# Altium schematic sheet USBHUB.SchDoc
size A
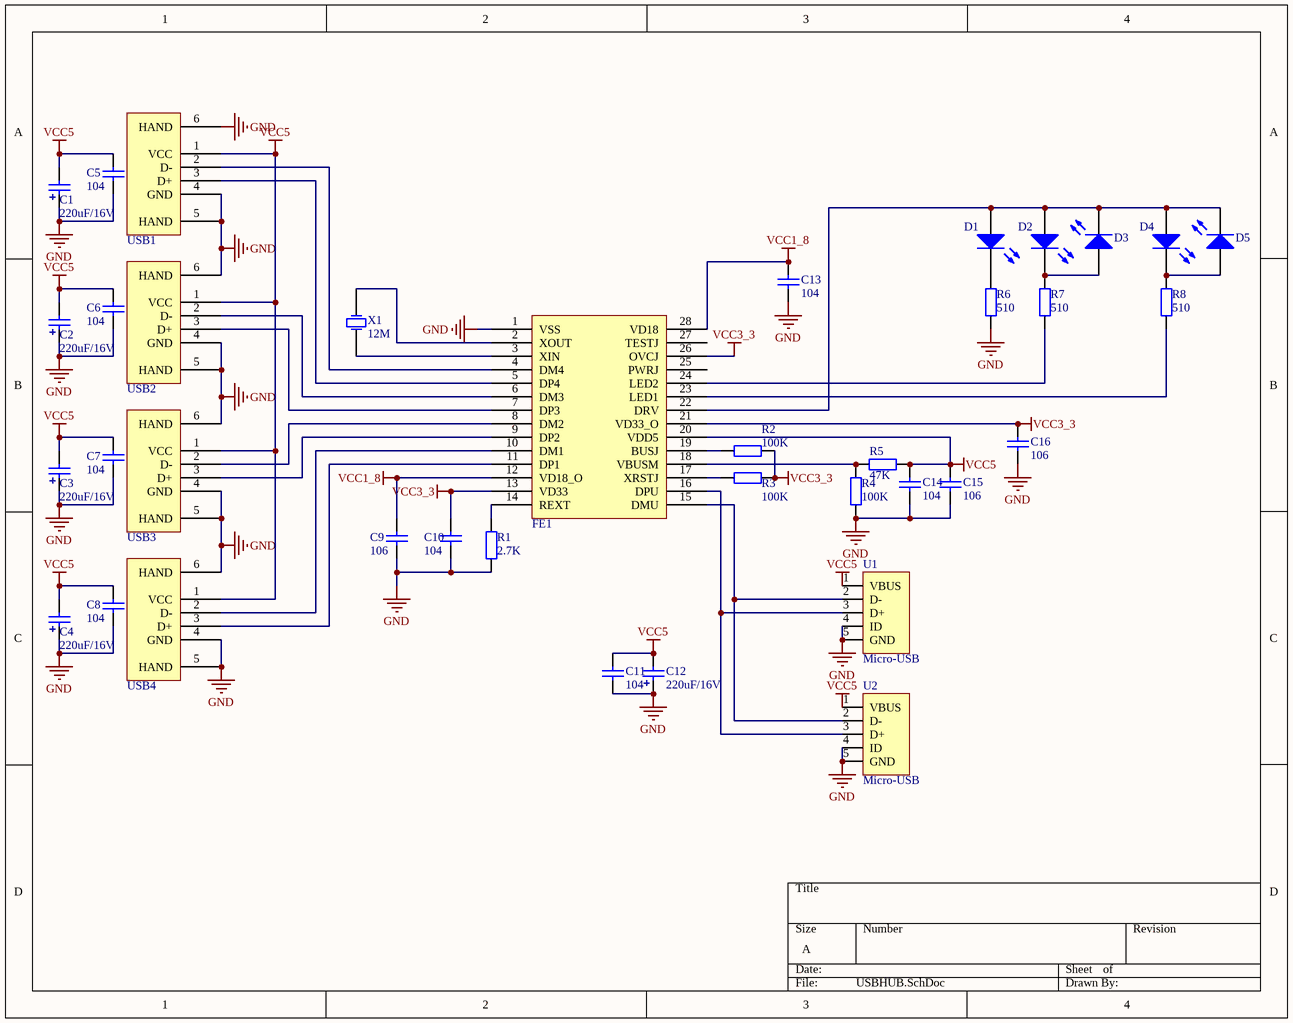
[diagram p0: USBHUB.SchDoc]

## Parts
C1  value 220uF/16V  [cap_220uF/16V]  (hidden comment: Cap_Pol)
C2  value 220uF/16V  [cap_220uF/16V]  (hidden comment: Cap_Pol)
C3  value 220uF/16V  [cap_220uF/16V]  (hidden comment: Cap_Pol)
C4  value 220uF/16V  [cap_220uF/16V]  (hidden comment: Cap_Pol)
C5  value 104  [0603]  (hidden comment: Cap1)
C6  value 104  [0603]  (hidden comment: Cap1)
C7  value 104  [0603]  (hidden comment: Cap1)
C8  value 104  [0603]  (hidden comment: Cap1)
C9  value 106  [2012[0805]-C]  (hidden comment: Cap1)
C10  value 104  [0603]  (hidden comment: Cap1)
C11  value 104  [0603]  (hidden comment: Cap1)
C12  value 220uF/16V  [cap_220uF/16V]  (hidden comment: Cap_Pol)
C13  value 104  [0603]  (hidden comment: Cap1)
C14  value 104  [0603]  (hidden comment: Cap1)
C15  value 106  [2012[0805]-C]  (hidden comment: Cap1)
C16  value 106  [2012[0805]-C]  (hidden comment: Cap1)
D1  LED  [0603-Polar]  (value not drawn)
D2  LED  [0603-Polar]  (value not drawn)
D3  LED  [0603-Polar]  (value not drawn)
D4  LED  [0603-Polar]  (value not drawn)
D5  LED  [0603-Polar]  (value not drawn)
FE1  FE1.1s  [SSOP-28]  (value not drawn)
R1  value 2.7K  [0603]  (hidden comment: Res1)
R2  value 100K  [0603]  (hidden comment: Res1)
R3  value 100K  [0603]  (hidden comment: Res1)
R4  value 100K  [0603]  (hidden comment: Res1)
R5  value 47K  [0603]  (hidden comment: Res1)
R6  value 510  [0603]  (hidden comment: Res1)
R7  value 510  [0603]  (hidden comment: Res1)
R8  value 510  [0603]  (hidden comment: Res1)
U1  Micro-USB  [MICRO-USB-F]
U2  Micro-USB  [MICRO-USB-F]
USB1  USB  [USB2.5-2V4A]  (value not drawn)
USB2  USB  [USB2.5-2V4A]  (value not drawn)
USB3  USB  [USB2.5-2V4A]  (value not drawn)
USB4  USB  [USB2.5-2V4A]  (value not drawn)
X1  12M  [XTAL_SMD]

## Nets
GND: C1.1 C2.1 C3.1 C4.1 C5.1 C6.1 C7.1 C8.1 C9.1 C10.1 C11.1 C12.1 C13.2 C14.1 C15.1 C16.1 FE1.1(VSS) R1.1 R4.1 R6.1 U1.4(ID) U1.5(GND) U2.4(ID) U2.5(GND) USB1.4(GND) USB1.5(HAND) USB1.6(HAND) USB2.4(GND) USB2.5(HAND) USB2.6(HAND) USB3.4(GND) USB3.5(HAND) USB3.6(HAND) USB4.4(GND) USB4.5(HAND) USB4.6(HAND)
VCC1_8: C9.2 C13.1 FE1.12(VD18_O) FE1.28(VD18)
VCC3_3: C10.2 C16.2 FE1.13(VD33) FE1.21(VD33_O) FE1.26(OVCJ) R2.2 R3.2
VCC5: C1.2 C2.2 C3.2 C4.2 C5.2 C6.2 C7.2 C8.2 C11.2 C12.2 C14.2 C15.2 FE1.20(VDD5) R5.2 U1.1(VBUS) U2.1(VBUS) USB1.1(VCC) USB2.1(VCC) USB3.1(VCC) USB4.1(VCC)
NetD1_1: D1.1(A) D2.1(A) D3.2(K) D4.1(A) D5.2(K) FE1.22(DRV)
NetD1_2: D1.2(K) R6.2
NetD2_2: D2.2(K) D3.1(A) R7.2
NetD4_2: D4.2(K) D5.1(A) R8.2
NetFE1_2: FE1.2(XOUT) X1.2(OSC2)
NetFE1_3: FE1.3(XIN) X1.1(OSC1)
NetFE1_4: FE1.4(DM4) USB1.2(D-)
NetFE1_5: FE1.5(DP4) USB1.3(D+)
NetFE1_6: FE1.6(DM3) USB2.2(D-)
NetFE1_7: FE1.7(DP3) USB2.3(D+)
NetFE1_8: FE1.8(DM2) USB3.2(D-)
NetFE1_9: FE1.9(DP2) USB3.3(D+)
NetFE1_10: FE1.10(DM1) USB4.2(D-)
NetFE1_11: FE1.11(DP1) USB4.3(D+)
NetFE1_14: FE1.14(REXT) R1.2
NetFE1_15: FE1.15(DMU) U1.2(D-) U2.2(D-)
NetFE1_16: FE1.16(DPU) U1.3(D+) U2.3(D+)
NetFE1_17: FE1.17(XRSTJ) R3.1
NetFE1_18: FE1.18(VBUSM) R4.2 R5.1
NetFE1_19: FE1.19(BUSJ) R2.1
NetFE1_23: FE1.23(LED1) R8.1
NetFE1_24: FE1.24(LED2) R7.1

Not connected (* = marked no-connect by the designer): FE1 25(PWRJ) 27(TESTJ)

## Library data of the parts
C1-C4 C12 = Cap_Pol: Capacitor; Published: 8-Jun-2000; LatestRevisionDate: 17-Jul-2002; LatestRevisionNote: Re-released for DXP Platform.; PackageReference: RAD-0.3; Publisher: Altium Limited
C5-C11 C13-C16 = Cap1: Capacitor; Published: 8-Jun-2000; LatestRevisionDate: 17-Jul-2002; LatestRevisionNote: Re-released for DXP Platform.; PackageReference: RAD-0.3; Publisher: Altium Limited
D1-D5 = LED1: Typical INFRARED GaAs LED; Published: 8-Jun-2000; LatestRevisionDate: 08-Jul-2005; LatestRevisionNote: Mech Layer 1 removed.; PackageReference: LED-0; Publisher: Altium Limited
R1-R8 = Res1: Resistor; Published: 8-Jun-2000; LatestRevisionDate: 17-Jul-2002; LatestRevisionNote: Re-released for DXP Platform.; PackageReference: AXIAL-0.4; Publisher: Altium Limited
X1 = XTAL_1: Crystal Oscillator; Published: 8-Jun-2000; LatestRevisionDate: 17-Jul-2002; LatestRevisionNote: Re-released for DXP Platform.; PackageReference: R38; Publisher: Altium Limited